# Altium project Node_TrungTam.PrjPcb
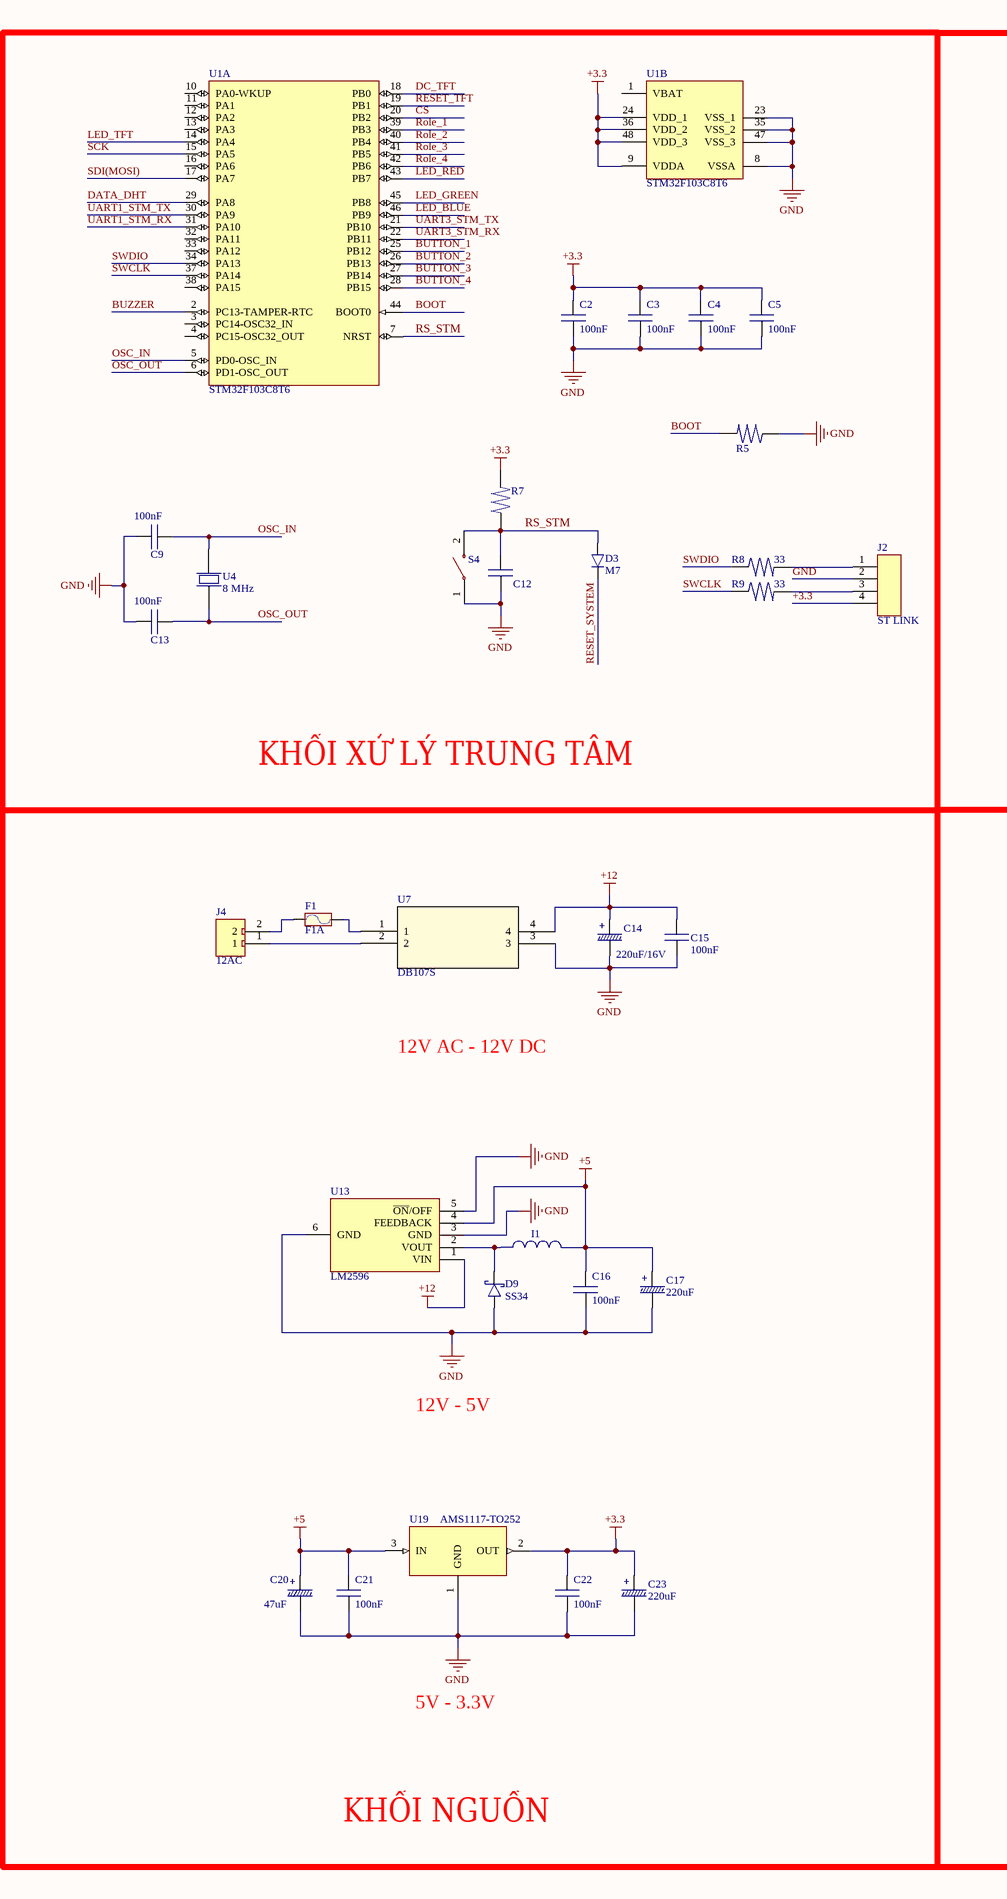
[diagram p0: Nguyen_Ly.SchDoc, left]
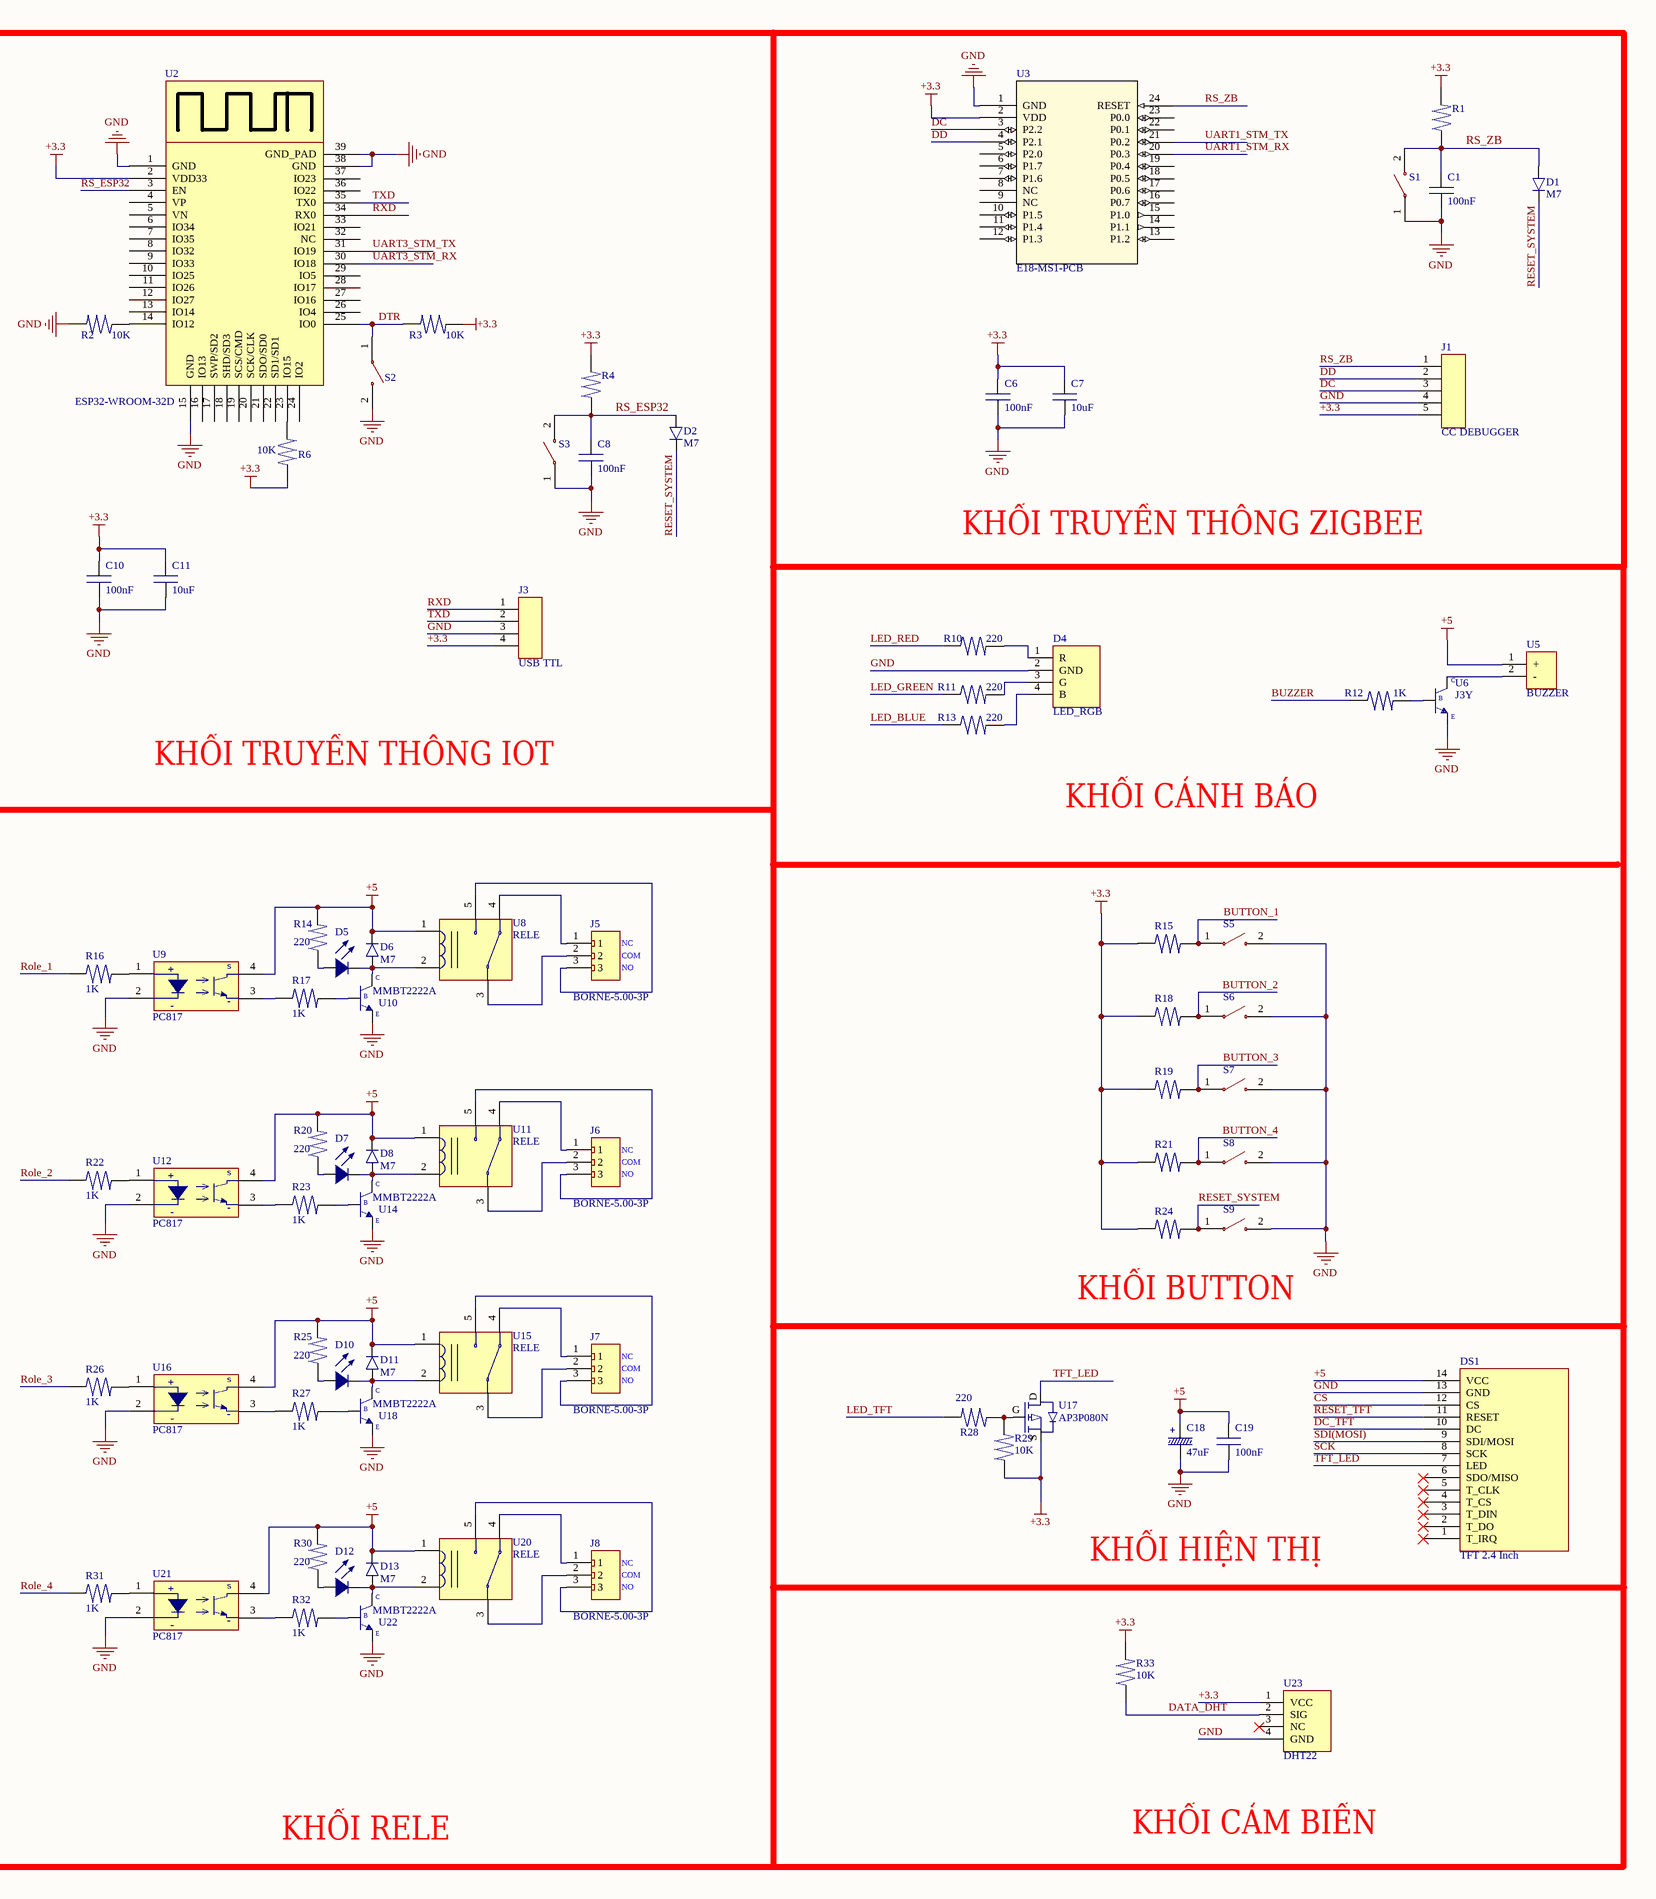
[diagram p1: Nguyen_Ly.SchDoc, right]
1 sheet, 112 parts. Net scope: global (net labels, ports and power ports of the same name join across sheets).
Board file: PCB_Final.PcbDoc

## Sheet Nguyen_Ly.SchDoc
size A2; SheetNumber: 1; SheetTotal: 1

### Parts
C1  100nF  [CAPACITOR 0805]
C2  100nF  [CAPACITOR 0805]
C3  100nF  [CAPACITOR 0805]
C4  100nF  [CAPACITOR 0805]
C5  100nF  [CAPACITOR 0805]
C6  100nF  [CAPACITOR 0805]
C7  10uF  [CAPACITOR 0805]
C8  100nF  [CAPACITOR 0805]
C9  100nF  [CAPACITOR 0805]
C10  100nF  [CAPACITOR 0805]
C11  10uF  [CAPACITOR 0805]
C12  CAPACITOR 0805  [CAPACITOR 0805]  (value not drawn)
C13  100nF  [CAPACITOR 0805]
C14  220uF/16V  [ALUMINUM_7mm]
C15  100nF  [CAPACITOR 0805]
C16  100nF  [CAPACITOR 0805]
C17  220uF  [ALUMINUM_7mm]
C18  47uF  [ALUMINUM_5mm]
C19  100nF  [CAPACITOR 0805]
C20  47uF  [ALUMINUM_5mm]
C21  100nF  [CAPACITOR 0805]
C22  100nF  [CAPACITOR 0805]
C23  220uF  [ALUMINUM_7mm]
D1  M7  [DIODE_SMA]
D2  M7  [DIODE_SMA]
D3  M7  [DIODE_SMA]
D4  LED_RGB  [LED_RGB_5mm]
D5  LED_0805_RED  [LED_0805_RED]  (value not drawn)
D6  M7  [DIODE_SMA]
D7  LED_0805_RED  [LED_0805_RED]  (value not drawn)
D8  M7  [DIODE_SMA]
D9  SS34  [DIODE_SMA]
D10  LED_0805_RED  [LED_0805_RED]  (value not drawn)
D11  M7  [DIODE_SMA]
D12  LED_0805_RED  [LED_0805_RED]  (value not drawn)
D13  M7  [DIODE_SMA]
DS1  TFT 2.4 Inch  [TFT 2.4 Inch]
F1  F1A  [Fuse]
I1  1260  [1260]  (value not drawn)
J1  CC DEBUGGER  [MALE-2.54-5P]
J2  ST LINK  [MALE-2.54-4P]
J3  USB TTL  [MALE-2.54-4P]
J4  12AC  [BORNE-5.00-2P]
J5  BORNE-5.00-3P  [BORNE-5.00-3P]
J6  BORNE-5.00-3P  [BORNE-5.00-3P]
J7  BORNE-5.00-3P  [BORNE-5.00-3P]
J8  BORNE-5.00-3P  [BORNE-5.00-3P]
R1  RESISTOR_0805  [RESISTOR_0805]  (value not drawn)
R2  10K  [RESISTOR_0805]
R3  10K  [RESISTOR_0805]
R4  RESISTOR_0805  [RESISTOR_0805]  (value not drawn)
R5  RESISTOR_0805  [RESISTOR_0805]  (value not drawn)
R6  10K  [RESISTOR_0805]
R7  RESISTOR_0805  [RESISTOR_0805]  (value not drawn)
R8  33  [RESISTOR_0805]
R9  33  [RESISTOR_0805]
R10  220  [RESISTOR_0805]
R11  220  [RESISTOR_0805]
R12  1K  [RESISTOR_0805]
R13  220  [RESISTOR_0805]
R14  220  [RESISTOR_0805]
R15  RESISTOR_0805  [RESISTOR_0805]  (value not drawn)
R16  1K  [RESISTOR_0805]
R17  1K  [RESISTOR_0805]
R18  RESISTOR_0805  [RESISTOR_0805]  (value not drawn)
R19  RESISTOR_0805  [RESISTOR_0805]  (value not drawn)
R20  220  [RESISTOR_0805]
R21  RESISTOR_0805  [RESISTOR_0805]  (value not drawn)
R22  1K  [RESISTOR_0805]
R23  1K  [RESISTOR_0805]
R24  RESISTOR_0805  [RESISTOR_0805]  (value not drawn)
R25  220  [RESISTOR_0805]
R26  1K  [RESISTOR_0805]
R27  1K  [RESISTOR_0805]
R28  220  [RESISTOR_0805]
R29  10K  [RESISTOR_0805]
R30  220  [RESISTOR_0805]
R31  1K  [RESISTOR_0805]
R32  1K  [RESISTOR_0805]
R33  10K  [RESISTOR_0805]
S1  PUSH_BUTTON_SMD_3X4X2  [PUSH_BUTTON_SMD_3X4X2]  (value not drawn)
S2  PUSH_BUTTON_SMD_3X4X2  [PUSH_BUTTON_SMD_3X4X2]  (value not drawn)
S3  PUSH_BUTTON_SMD_3X4X2  [PUSH_BUTTON_SMD_3X4X2]  (value not drawn)
S4  PUSH_BUTTON_SMD_3X4X2  [PUSH_BUTTON_SMD_3X4X2]  (value not drawn)
S5  PUSH_BUTTON_12X12  [PUSH_BUTTON_12X12_BLUE]  (value not drawn)
S6  PUSH_BUTTON_12X12  [PUSH_BUTTON_12X12_GREEN]  (value not drawn)
S7  PUSH_BUTTON_12X12  [PUSH_BUTTON_12X12_RED]  (value not drawn)
S8  PUSH_BUTTON_12X12  [PUSH_BUTTON_12X12_YELLOW]  (value not drawn)
S9  PUSH_BUTTON_6X6  [PUSH_BUTTON_6X6]  (value not drawn)
U1  STM32F103C8T6  [STM-LQFP48_N]  (parts A,B of 2)
U2  ESP32-WROOM-32D  [ESP32-WROOM-32D]
U3  E18-MS1-PCB  [E18-MS1-PCB_BYT]
U4  8 MHz  [CRISTAL_16Mhz]
U5  BUZZER  [BUZZER_12mm]
U6  J3Y  [J3Y]
U7  DB107S  [DB107S]
U8  RELE  [RELE]
U9  PC817  [PC817_DIP]
U10  MMBT2222A  [J3Y]
U11  RELE  [RELE]
U12  PC817  [PC817_DIP]
U13  LM2596  [LM2596]
U14  MMBT2222A  [J3Y]
U15  RELE  [RELE]
U16  PC817  [PC817_DIP]
U17  AP3P080N  [SOT23-3]
U18  MMBT2222A  [J3Y]
U19  AMS1117-TO252  [AMS117-TO252]
U20  RELE  [RELE]
U21  PC817  [PC817_DIP]
U22  MMBT2222A  [J3Y]
U23  DHT22  [DHT22_90]

### Blocks framed on the sheet
KHỐI XỬ LÝ TRUNG TÂM: C2-C5 C9 C12 C13 D3 J2 R5 R7-R9 S4 U1 U4

### Nets
+3.3: C2.2 C3.2 C4.2 C5.2 C6.2 C7.2 C10.2 C11.2 C22.2 C23.1 J1.5 J2.4 J3.4 R1.2 R3.1 R4.2 R6.2 R7.2 R15.1 R18.1 R19.1 R21.1 R24.1 R29.1 R33.2 U1.9(VDDA) U1.24(VDD_1) U1.36(VDD_2) U1.48(VDD_3) U2.2(VDD33) U3.2(VDD) U17.S U19.2(OUT) U23.1(VCC)
+5: C16.2 C17.1 C18.1 C19.2 C20.1 C21.2 D6.2 D8.2 D11.2 D13.2 DS1.14(VCC) I1.2 R14.2 R20.2 R25.2 R30.2 U5.1(+) U8.1 U9.4(SIGNAL) U11.1 U12.4(SIGNAL) U13.4(FEEDBACK) U15.1 U16.4(SIGNAL) U19.3(IN) U20.1 U21.4(SIGNAL)
+12: C14.1 C15.2 U7.4 U13.1(VIN)
GND: C1.1 C2.1 C3.1 C4.1 C5.1 C6.1 C7.1 C8.1 C9.2 C10.1 C11.1 C12.1 C13.2 C14.2 C15.1 C16.1 C17.2 C18.2 C19.1 C20.2 C21.1 C22.1 C23.2 D4.2(GND) D9.1 DS1.13(GND) J1.4 J2.2 J3.3 R2.2 R5.1 S1.1 S2.2 S3.1 S4.1 S5.2 S6.2 S7.2 S8.2 S9.2 U1.8(VSSA) U1.23(VSS_1) U1.35(VSS_2) U1.47(VSS_3) U2.1(GND) U2.15(GND) U2.38(GND) U2.39(GND_PAD) U3.1(GND) U6.2(E) U7.3 U9.2(GND) U10.2(E) U12.2(GND) U13.3(GND) U13.5(~{ON}/OFF) U13.6(GND) U14.2(E) U16.2(GND) U18.2(E) U19.1(GND) U21.2(GND) U22.2(E) U23.4(GND)
BOOT: R5.2 U1.44(BOOT0)
BUTTON_1: R15.2 S5.1 U1.25(PB12)
BUTTON_2: R18.2 S6.1 U1.26(PB13)
BUTTON_3: R19.2 S7.1 U1.27(PB14)
BUTTON_4: R21.2 S8.1 U1.28(PB15)
BUZZER: R12.1 U1.2(PC13-TAMPER-RTC)
CS: DS1.12(CS) U1.20(PB2)
DATA_DHT: R33.1 U1.29(PA8) U23.2(SIG)
DC: J1.3 U3.3(P2.2)
DC_TFT: DS1.10(DC) U1.18(PB0)
DD: J1.2 U3.4(P2.1)
DTR: R3.2 S2.1 U2.25(IO0)
LED_BLUE: R13.1 U1.46(PB9)
LED_GREEN: R11.1 U1.45(PB8)
LED_RED: R10.1 U1.43(PB7)
LED_TFT: R28.2 U1.14(PA4)
OSC_IN: C9.1 U1.5(PD0-OSC_IN) U4.2
OSC_OUT: C13.1 U1.6(PD1-OSC_OUT) U4.1
RESET_SYSTEM: D1.2 D2.2 D3.2 R24.2 S9.1
RESET_TFT: DS1.11(RESET) U1.19(PB1)
Role_1: R16.1 U1.39(PB3)
Role_2: R22.1 U1.40(PB4)
Role_3: R26.1 U1.41(PB5)
Role_4: R31.1 U1.42(PB6)
RS_ESP32: C8.2 D2.1 R4.1 S3.2 U2.3(EN)
RS_STM: C12.2 D3.1 R7.1 S4.2 U1.7(NRST)
RS_ZB: C1.2 D1.1 J1.1 R1.1 S1.2 U3.24(RESET)
RXD: J3.1 U2.34(RX0)
SCK: DS1.8(SCK) U1.15(PA5)
SDI(MOSI): DS1.9(SDI/MOSI) U1.17(PA7)
SWCLK: R9.1 U1.37(PA14)
SWDIO: R8.1 U1.34(PA13)
TFT_LED: DS1.7(LED) U17.D
TXD: J3.2 U2.35(TX0)
UART1_STM_RX: U1.31(PA10) U3.20(P0.3)
UART1_STM_TX: U1.30(PA9) U3.21(P0.2)
UART3_STM_RX: U1.22(PB11) U2.30(IO18)
UART3_STM_TX: U1.21(PB10) U2.31(IO19)
NetD4_1: D4.1(R) R10.2
NetD4_3: D4.3(G) R11.2
NetD4_4: D4.4(B) R13.2
NetD5_1: D5.1 R14.1
NetD5_2: D5.2 D6.1 U8.2 U10.3(C)
NetD7_1: D7.1 R20.1
NetD7_2: D7.2 D8.1 U11.2 U14.3(C)
NetD9_2: D9.2 I1.1 U13.2(VOUT)
NetD10_1: D10.1 R25.1
NetD10_2: D10.2 D11.1 U15.2 U18.3(C)
NetD12_1: D12.1 R30.1
NetD12_2: D12.2 D13.1 U20.2 U22.3(C)
NetF1_1: F1.1 J4.2
NetF1_2: F1.2 U7.1
NetJ2_1: J2.1 R8.2
NetJ2_3: J2.3 R9.2
NetJ4_1: J4.1 U7.2
NetJ5_1: J5.1 U8.4
NetJ5_2: J5.2 U8.3
NetJ5_3: J5.3 U8.5
NetJ6_1: J6.1 U11.4
NetJ6_2: J6.2 U11.3
NetJ6_3: J6.3 U11.5
NetJ7_1: J7.1 U15.4
NetJ7_2: J7.2 U15.3
NetJ7_3: J7.3 U15.5
NetJ8_1: J8.1 U20.4
NetJ8_2: J8.2 U20.3
NetJ8_3: J8.3 U20.5
NetR2_1: R2.1 U2.14(IO12)
NetR6_1: R6.1 U2.23(IO15)
NetR12_2: R12.2 U6.1(B)
NetR16_2: R16.2 U9.1(VCC)
NetR17_1: R17.1 U9.3(GND)
NetR17_2: R17.2 U10.1(B)
NetR22_2: R22.2 U12.1(VCC)
NetR23_1: R23.1 U12.3(GND)
NetR23_2: R23.2 U14.1(B)
NetR26_2: R26.2 U16.1(VCC)
NetR27_1: R27.1 U16.3(GND)
NetR27_2: R27.2 U18.1(B)
NetR28_1: R28.1 R29.2 U17.G
NetR31_2: R31.2 U21.1(VCC)
NetR32_1: R32.1 U21.3(GND)
NetR32_2: R32.2 U22.1(B)
NetU5_2: U5.2(-) U6.3(C)

Not connected (* = marked no-connect by the designer): DS1 1(T_IRQ)* 2(T_DO)* 3(T_DIN)* 4(T_CS)* 5(T_CLK)* 6(SDO/MISO)*; U1 1(VBAT) 3(PC14-OSC32_IN) 4(PC15-OSC32_OUT) 10(PA0-WKUP) 11(PA1) 12(PA2) 13(PA3) 16(PA6) 32(PA11) 33(PA12) 38(PA15); U2 4(VP) 5(VN) 6(IO34) 7(IO35) 8(IO32) 9(IO33) 10(IO25) 11(IO26) 12(IO27) 13(IO14) 16(IO13) 17(SWP/SD2) 18(SHD/SD3) 19(SCS/CMD) 20(SCK/CLK) 21(SDO/SD0) 22(SD1/SD1) 24(IO2) 26(IO4) 27(IO16) 28(IO17) 29(IO5) 32(NC) 33(IO21) 36(IO22) 37(IO23); U3 5(P2.0) 6(P1.7) 7(P1.6) 8(NC) 9(NC) 10(P1.5) 11(P1.4) 12(P1.3) 13(P1.2) 14(P1.1) 15(P1.0) 16(P0.7) 17(P0.6) 18(P0.5) 19(P0.4) 22(P0.1) 23(P0.0); U23 3(NC)*

### Notes on the sheet
- KHỐI TRUYỀN THÔNG ZIGBEE
- KHỐI TRUYỀN THÔNG IOT
- KHỐI CẢNH BÁO
- (near J5) NC
- (near J5) COM
- (near J5) NO
- 12V AC - 12V DC
- (near J6) NC
- (near J6) COM
- (near J6) NO
- KHỐI BUTTON
- (near J7) NC
- (near J7) COM
- 12V - 5V
- (near J7) NO
- (near J8) NC
- KHỐI HIỆN THỊ
- (near J8) COM
- (near J8) NO
- 5V - 3.3V
- KHỐI NGUỒN
- KHỐI RELE
- KHỐI CẢM BIẾN
- (in symbol 100uF/10V) +

### Library data of the parts
C1-C13 C15 C16 C19 C21 C22 = CAPACITOR 0805: Generic Capacitor 0805, 2x1.25x1.4mm.
C14 C17 C23 = 220uF/16V: Aluminum Capacitor 220uF/16V 7mm
C18 C20 = 47uF/16V: Aluminum Capacitor 47uF/16V 5mm
D1-D3 D6 D8 D11 D13 = M7: Rectifiers Diode 1000V 1A SMA; ComponentLink1Description: Datasheet; Mouser PN: 637-M7; Digikey PN: 3191-M7CT-ND; JLCPCB PN: C330214
D4 = LED_RGB_5mm: LED RGB 4 Pins 5mm Common Cathode.; JLCPCB PN: C2837021
D5 D7 D10 D12 = LED_0805_RED: LED 0805 Red.; JLCPCB PN: C113551
D9 = SS34: Rectifier Schottky 40V 3A SMA; Mouser PN: 512-SS34; ComponentLink1Description: Datasheet; Digikey PN: SS34FSTR-ND; JLCPCB: C2909963
DS1 = TFT 2.4 Inch: 2.4-inch TFT LCD module, 14-pin interface
F1 = Fuse: Designed by: VanDungEvn; Value: Fuse
I1 = 1260: Generic Encapsulated Inductor 1260.
J1 = MALE-2.54-5P: Male Header Connector 2.54mm 5 Pins.; JLCPCB PN: C492404
J2 J3 = MALE-2.54-4P: Male Header Connector 2.54mm 4 Pins.; JLCPCB PN: C492403
J4 = BORNE-5.00-2P: Borne 2 Vias, Pitch 5mm.; JLCPCB PN: C91153
J5-J8 = BORNE-5.00-3P: Borne 3 Vias, Pitch 5mm.; JLCPCB PN: C91154
R1-R33 = RESISTOR_0805: Generic Resistor 0805.
S1-S4 = PUSH_BUTTON_SMD_3X4X2: Push Button Tactile Switch SMD 2 Pins 3x4x2mm.; JLCPCB PN: C231644
S5-S8 = PUSH_BUTTON_12X12: Push Button Tactile Switch PTH 4 Pins 12x12mm.; Mouser PN: 992-BUTT-12-5; JLCPCB PN: C84931
S9 = PUSH_BUTTON_6X6: Push Button Tactile Switch PTH 4 Pins 6x6mm.; JLCPCB PN: C255811
U1 = STM32F103C8T6: ARM Cortex-M3 32-bit MCU, 64 KB Flash, 20 KB Internal RAM, 37 I/Os, 48-pin LQFP, -40 to 85 degC, Tray; A/D Converter: 2x12-bit (10 Channel); FLASH Size (Prog) (kB): 64; I/Os (High Current): 37; Internal RAM Size (kB): 20; Operating Frequency(F) (Processor speed) (MHz): 72; Supply Voltage(Vcc) min (V): 2; DatasheetVersion: Rev. 16; PackageVersion: Rev. 6, 06/2013; PackageReference: LQFP48; PackageDescription: 48-Pin Low Profile Quad Flat Package, 7 x 7 mm Body, 0.5 mm Pitch; Supplier 1: Digi-Key; Supplier Part Number 1: 497-6063-ND; Supplier 2: Farnell; Supplier Part Number 2: 1447637; Supplier 3: Newark; Supplier Part Number 3: 59M2182; Supplier 4: Newark; Supplier Part Number 4: 57P1222; Supplier 5: Mouser; Supplier Part Number 5: 511-STM32F103C8T6; Core: ARM Cortex-M3; Packing: Tray; Mounting Technology: Surface Mount; PartNumber: STM32F103C8T6; ComponentLink1Description: Manufacturer URL; ComponentLink1URL: http://www.st.com/web/en/home.html; ComponentLink2Description: Datasheet; ComponentLink2URL: http://www.st.com/st-web-ui/static/active/en/resource/technical/document/datasheet/CD00161566.pdf; ComponentLink3Description: Package Specification; ComponentLink3URL: http://www.st.com/st-web-ui/static/active/en/resource/technical/document/datasheet/DM00058181.pdf
U2 = ESP32-WROOM-32D: Chip SMD 39 Pads Wifi 2.4GHz BLE 4.2 18x25.5mm w/ Antenna.; Mouser PN: ESP32-WROOM-32D-N4; Digikey PN: 1965-ESP32-WROOM-32D-N8CT-ND; ComponentLink1Description: Datasheet; ComponentLink1URL: https://www.mouser.com/datasheet/2/891/esp32_wroom_32d_esp32_wroom_32u_datasheet_en-1365844.pdf; JLCPCB PN: C82899
U3 = E18-MS1-PCB: No Description Available; Manufacturer_Name: Chengdu Ebyte Elec Tech; Copyright: Copyright (C) 2026 Ultra Librarian. All rights reserved.; Manufacturer_Part_Number: E18-MS1-PCB; RefDes: RefDes; Type: Type
U4 = CRISTAL_16Mhz: CRYSTAL 16MHZ, PTH and SMD; Mouser PN: 449-LFXTAL022786BULK; Digikey PN: 3155-16M20P2/49US-ND
U5 = BUZZER_12mm: BUZZER MAGNETIC 12MM; Digikey PN: 433-WT-1209T-ND; Mouser PN: 433-WT-1209T-ND; JLCPCB PN: C781866
U6 U10 U14 U18 U22 = J3Y: TRANSISTOR BIPOLAR (BJT) NPN 25V 500mA SOT-23-3; Digikey PN: 4518-S8050CT-ND; ComponentLink1Description: Datasheet; ComponentLink1URL: https://media.digikey.com/pdf/Data%20Sheets/UTD%20Semi%20PDFs/S8050.pdf; JLCPCB PN: C2828466
U7 = DB107S: Description; Manufacturer_Name: Rectron; Copyright: Copyright (C) 2025 Ultra Librarian. All rights reserved.; Manufacturer_Part_Number: DB107S; RefDes: RefDes; Type: Type
U8 U11 U15 U20 = RELE: Generic Rele PTH 5 Pins.
U9 U12 U16 U21 = PC817: Optocouplers Phototransistor 4 Pins, DIP and SMD.; ComponentLink1Description: Datasheet; ComponentLink1URL: https://www.farnell.com/datasheets/73758.pdf; JLCPCB PN SMD: C3025164; JLCPCB PN DIP: C3008368
U13 = LM2596: IC BUCK STEP DOWN 3A TO-263-6; ComponentLink1Description: Datasheet; ComponentLink1URL: https://www.ti.com/lit/ds/symlink/lm2596.pdf; Mouser PN: 863-LM2596DSADJG; Digikey PN: 4518-LM2596S-ADJCT-ND; JLCPCB PN: C2980822
U17 = AP3P080N: Mosfet PNP
U19 = AMS1117-TO252: MP: AZ1117D-3.3TRE1; MF: Diodes Inc.; Package: TO-252-2 Diodes Inc.; Availability: In Stock; Price: None; Purchase-URL: https://pricing.snapeda.com/search/part/AZ1117D-3.3TRE1/?ref=eda; Check_prices: https://www.snapeda.com/parts/AZ1117D-3.3TRE1/Diodes+Inc./view-part/?ref=eda; SnapEDA_Link: https://www.snapeda.com/parts/AZ1117D-3.3TRE1/Diodes+Inc./view-part/?ref=snap; Value: *
U23 = DHT22: SENSOR HUMIDITY/TEMPERATURE; Digikey PN: 1528-1228-ND